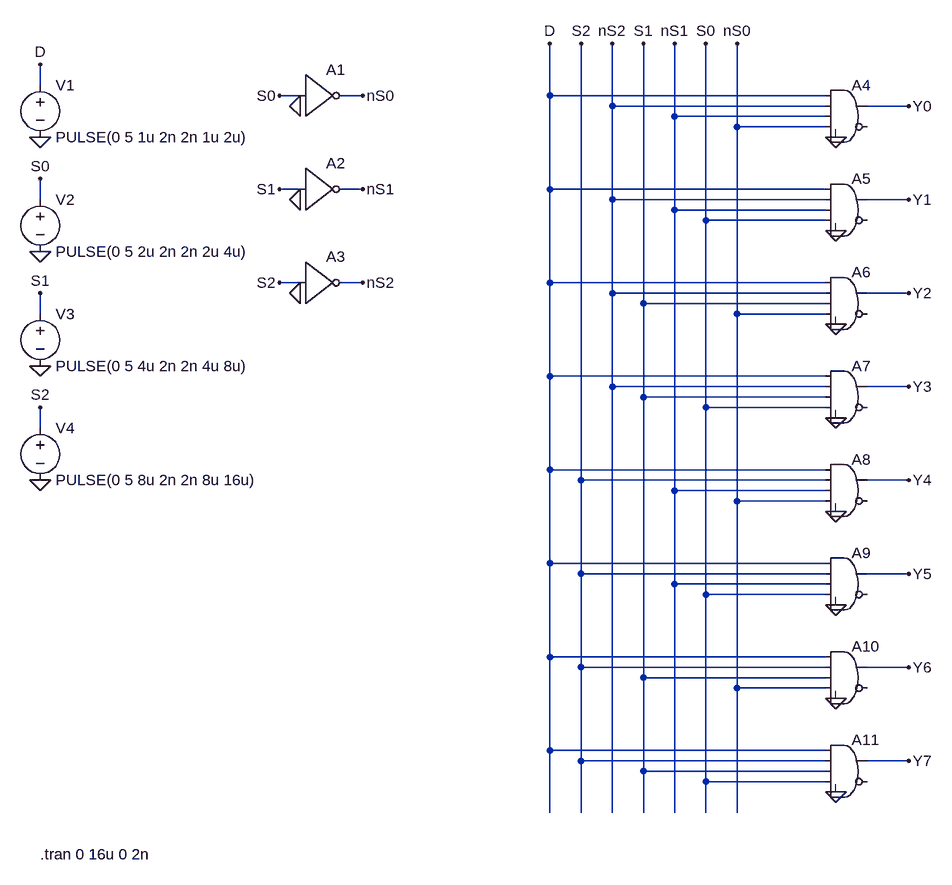
[diagram p0: schematic demux_1x8.asc]
demux_1x8.asc, the LTspice schematic file:
Version 4
SHEET 1 1736 1584
WIRE -720 -16 -720 16
WIRE -720 160 -720 192
WIRE -720 336 -720 368
WIRE -720 512 -720 544
WIRE -352 32 -320 32
WIRE -224 32 -256 32
WIRE -352 176 -320 176
WIRE -224 176 -256 176
WIRE -352 320 -320 320
WIRE -224 320 -256 320
WIRE 64 1136 64 -48
WIRE 112 1136 112 -48
WIRE 160 1136 160 -48
WIRE 208 1136 208 -48
WIRE 256 1136 256 -48
WIRE 304 1136 304 -48
WIRE 352 1136 352 -48
WIRE 488 32 64 32
WIRE 488 48 160 48
WIRE 488 64 256 64
WIRE 488 80 352 80
WIRE 504 96 488 96
WIRE 616 48 552 48
WIRE 488 176 64 176
WIRE 488 192 160 192
WIRE 488 208 256 208
WIRE 488 224 304 224
WIRE 504 240 488 240
WIRE 616 192 552 192
WIRE 488 320 64 320
WIRE 488 336 160 336
WIRE 488 352 208 352
WIRE 488 368 352 368
WIRE 504 384 488 384
WIRE 616 336 552 336
WIRE 488 464 64 464
WIRE 488 480 160 480
WIRE 488 496 208 496
WIRE 488 512 304 512
WIRE 504 528 488 528
WIRE 616 480 552 480
WIRE 488 608 64 608
WIRE 488 624 112 624
WIRE 488 640 256 640
WIRE 488 656 352 656
WIRE 504 672 488 672
WIRE 616 624 552 624
WIRE 488 752 64 752
WIRE 488 768 112 768
WIRE 488 784 256 784
WIRE 488 800 304 800
WIRE 504 816 488 816
WIRE 616 768 552 768
WIRE 488 896 64 896
WIRE 488 912 112 912
WIRE 488 928 208 928
WIRE 488 944 352 944
WIRE 504 960 488 960
WIRE 616 912 552 912
WIRE 488 1040 64 1040
WIRE 488 1056 112 1056
WIRE 488 1072 208 1072
WIRE 488 1088 304 1088
WIRE 504 1104 488 1104
WIRE 616 1056 552 1056
FLAG -720 -16 D
FLAG -720 96 0
FLAG -720 160 S0
FLAG -720 272 0
FLAG -720 336 S1
FLAG -720 448 0
FLAG -720 512 S2
FLAG -720 624 0
FLAG -352 32 S0
FLAG -224 32 nS0
FLAG -320 48 0
FLAG -352 176 S1
FLAG -224 176 nS1
FLAG -320 192 0
FLAG -352 320 S2
FLAG -224 320 nS2
FLAG -320 336 0
FLAG 64 -48 D
FLAG 112 -48 S2
FLAG 160 -48 nS2
FLAG 208 -48 S1
FLAG 256 -48 nS1
FLAG 304 -48 S0
FLAG 352 -48 nS0
FLAG 504 96 0
FLAG 616 48 Y0
FLAG 504 240 0
FLAG 616 192 Y1
FLAG 504 384 0
FLAG 616 336 Y2
FLAG 504 528 0
FLAG 616 480 Y3
FLAG 504 672 0
FLAG 616 624 Y4
FLAG 504 816 0
FLAG 616 768 Y5
FLAG 504 960 0
FLAG 616 912 Y6
FLAG 504 1104 0
FLAG 616 1056 Y7
SYMBOL voltage -720 0 R0
SYMATTR InstName V1
SYMATTR Value PULSE(0 5 1u 2n 2n 1u 2u)
SYMBOL voltage -720 176 R0
SYMATTR InstName V2
SYMATTR Value PULSE(0 5 2u 2n 2n 2u 4u)
SYMBOL voltage -720 352 R0
SYMATTR InstName V3
SYMATTR Value PULSE(0 5 4u 2n 2n 4u 8u)
SYMBOL voltage -720 528 R0
SYMATTR InstName V4
SYMATTR Value PULSE(0 5 8u 2n 2n 8u 16u)
SYMBOL Digital\\inv -320 -32 R0
SYMATTR InstName A1
SYMATTR SpiceLine Vhigh=5 Vlow=0 Ref=2.5 Td=10n
SYMBOL Digital\\inv -320 112 R0
SYMATTR InstName A2
SYMATTR SpiceLine Vhigh=5 Vlow=0 Ref=2.5 Td=10n
SYMBOL Digital\\inv -320 256 R0
SYMATTR InstName A3
SYMATTR SpiceLine Vhigh=5 Vlow=0 Ref=2.5 Td=10n
SYMBOL Digital\\and 520 0 R0
SYMATTR InstName A4
SYMATTR SpiceLine Vhigh=5 Vlow=0 Ref=2.5 Td=10n
SYMBOL Digital\\and 520 144 R0
SYMATTR InstName A5
SYMATTR SpiceLine Vhigh=5 Vlow=0 Ref=2.5 Td=10n
SYMBOL Digital\\and 520 288 R0
SYMATTR InstName A6
SYMATTR SpiceLine Vhigh=5 Vlow=0 Ref=2.5 Td=10n
SYMBOL Digital\\and 520 432 R0
SYMATTR InstName A7
SYMATTR SpiceLine Vhigh=5 Vlow=0 Ref=2.5 Td=10n
SYMBOL Digital\\and 520 576 R0
SYMATTR InstName A8
SYMATTR SpiceLine Vhigh=5 Vlow=0 Ref=2.5 Td=10n
SYMBOL Digital\\and 520 720 R0
SYMATTR InstName A9
SYMATTR SpiceLine Vhigh=5 Vlow=0 Ref=2.5 Td=10n
SYMBOL Digital\\and 520 864 R0
SYMATTR InstName A10
SYMATTR SpiceLine Vhigh=5 Vlow=0 Ref=2.5 Td=10n
SYMBOL Digital\\and 520 1008 R0
SYMATTR InstName A11
SYMATTR SpiceLine Vhigh=5 Vlow=0 Ref=2.5 Td=10n
TEXT -720 1200 Left 2 !.tran 0 16u 0 2n

The netlist it stands for:
* demux_1x8.asc
V1 D 0 PULSE(0 5 1u 2n 2n 1u 2u)
V2 S0 0 PULSE(0 5 2u 2n 2n 2u 4u)
V3 S1 0 PULSE(0 5 4u 2n 2n 4u 8u)
V4 S2 0 PULSE(0 5 8u 2n 2n 8u 16u)
A1 S0 0 0 0 0 nS0 0 0 BUF Vhigh=5 Vlow=0 Ref=2.5 Td=10n
A2 S1 0 0 0 0 nS1 0 0 BUF Vhigh=5 Vlow=0 Ref=2.5 Td=10n
A3 S2 0 0 0 0 nS2 0 0 BUF Vhigh=5 Vlow=0 Ref=2.5 Td=10n
A4 D nS2 nS1 nS0 0 0 Y0 0 AND Vhigh=5 Vlow=0 Ref=2.5 Td=10n
A5 D nS2 nS1 S0 0 0 Y1 0 AND Vhigh=5 Vlow=0 Ref=2.5 Td=10n
A6 D nS2 S1 nS0 0 0 Y2 0 AND Vhigh=5 Vlow=0 Ref=2.5 Td=10n
A7 D nS2 S1 S0 0 0 Y3 0 AND Vhigh=5 Vlow=0 Ref=2.5 Td=10n
A8 D S2 nS1 nS0 0 0 Y4 0 AND Vhigh=5 Vlow=0 Ref=2.5 Td=10n
A9 D S2 nS1 S0 0 0 Y5 0 AND Vhigh=5 Vlow=0 Ref=2.5 Td=10n
A10 D S2 S1 nS0 0 0 Y6 0 AND Vhigh=5 Vlow=0 Ref=2.5 Td=10n
A11 D S2 S1 S0 0 0 Y7 0 AND Vhigh=5 Vlow=0 Ref=2.5 Td=10n
.tran 0 16u 0 2n
.backanno
.end